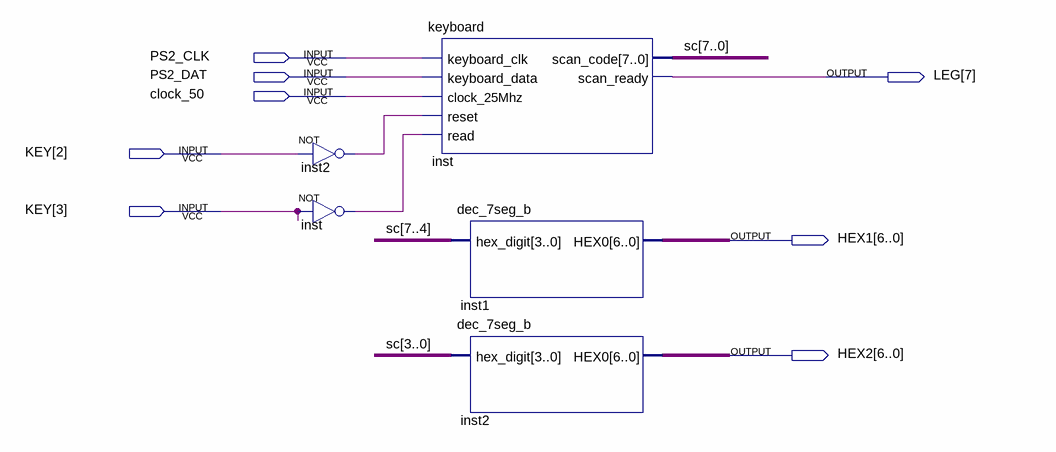
[diagram p0: schematic sheet]
// Quartus schematic Keyboard and dec_7seg_b.bdf as structural Verilog: 5 symbols, 8 pins
module \Keyboard_and_dec_7seg_b  (
  input  PS2_CLK,
  input  PS2_DAT,
  input  clock_50,
  input  [3:2] KEY,
  output [7:7] LEG,
  output [6:0] HEX1,
  output [6:0] HEX2
);

  wire inst2_out, inst_out;
  wire [7:0] sc;

  not inst2 (inst2_out, KEY[2]);
  not inst (inst_out, KEY[3]);
  keyboard inst_dup2 (
    .keyboard_clk(PS2_CLK), .keyboard_data(PS2_DAT), .clock_25Mhz(clock_50), .reset(inst2_out),
    .read(inst_out), .scan_code(sc), .scan_ready(LEG[7]));
  dec_7seg_b inst1 (.hex_digit(sc[7:4]), .HEX0(HEX1));
  dec_7seg_b inst2_dup2 (.hex_digit(sc[3:0]), .HEX0(HEX2));
endmodule
